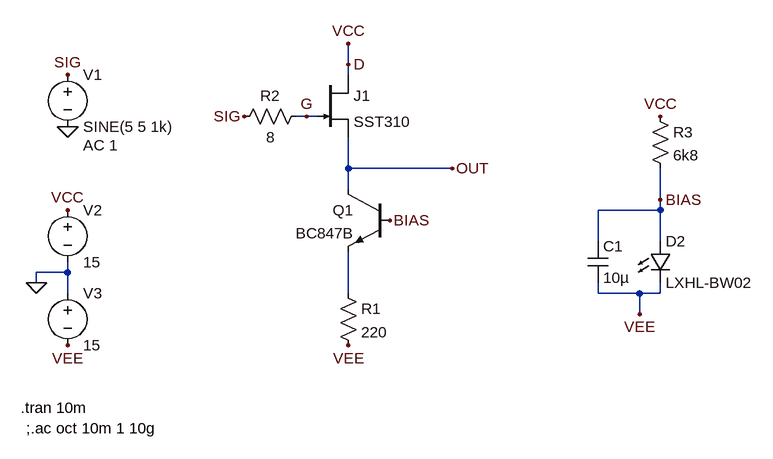
[diagram p0: schematic jfet-n.asc]
jfet-n.asc, the LTspice schematic file:
Version 4
SHEET 1 1144 680
WIRE 448 80 448 48
WIRE 448 96 448 80
WIRE 384 160 368 160
WIRE 400 160 384 160
WIRE 448 240 448 192
WIRE 608 240 448 240
WIRE 448 272 448 240
WIRE 928 288 928 240
WIRE 928 304 928 288
WIRE 928 304 832 304
WIRE 832 352 832 304
WIRE 928 352 928 304
WIRE 16 400 16 384
WIRE 16 400 -32 400
WIRE -32 416 -32 400
WIRE 16 432 16 400
WIRE 448 432 448 368
WIRE 832 432 832 416
WIRE 896 432 832 432
WIRE 928 432 928 416
WIRE 928 432 896 432
WIRE 896 464 896 432
FLAG 16 96 SIG
FLAG 16 176 0
FLAG 288 160 SIG
FLAG -32 416 0
FLAG 16 304 VCC
FLAG 16 512 VEE
FLAG 448 48 VCC
FLAG 928 160 VCC
FLAG 448 512 VEE
FLAG 896 464 VEE
FLAG 512 320 BIAS
FLAG 928 288 BIAS
FLAG 608 240 OUT
FLAG 384 160 G
FLAG 448 80 D
SYMBOL voltage 16 80 R0
WINDOW 123 24 124 Left 2
WINDOW 39 0 0 Left 0
SYMATTR Value2 AC 1
SYMATTR InstName V1
SYMATTR Value SINE(5 5 1k)
SYMBOL njf 400 96 R0
SYMATTR InstName J1
SYMATTR Value SST310
SYMBOL res 432 416 R0
SYMATTR InstName R1
SYMATTR Value 220
SYMBOL res 384 144 R90
WINDOW 0 0 56 VBottom 2
WINDOW 3 32 56 VTop 2
SYMATTR InstName R2
SYMATTR Value 8
SYMBOL npn 512 272 M0
SYMATTR InstName Q1
SYMATTR Value BC847B
SYMBOL voltage 16 288 R0
WINDOW 123 0 0 Left 0
WINDOW 39 0 0 Left 0
SYMATTR InstName V2
SYMATTR Value 15
SYMBOL voltage 16 416 R0
WINDOW 123 0 0 Left 0
WINDOW 39 0 0 Left 0
SYMATTR InstName V3
SYMATTR Value 15
SYMBOL res 912 144 R0
SYMATTR InstName R3
SYMATTR Value 6k8
SYMBOL cap 816 352 R0
SYMATTR InstName C1
SYMATTR Value 10µ
SYMBOL LED 912 352 R0
SYMATTR InstName D2
SYMATTR Value LXHL-BW02
TEXT -56 608 Left 2 !.tran 10m
TEXT -48 640 Left 2 !;.ac oct 10m 1 10g

The netlist it stands for:
* jfet-n.asc
V1 SIG 0 SINE(5 5 1k) AC 1
J1 D G OUT SST310
R1 N001 VEE 220
R2 G SIG 8
Q1 OUT BIAS N001 0 BC847B
V2 D 0 15
V3 0 VEE 15
R3 D BIAS 6k8
C1 BIAS VEE 10µ
D2 BIAS VEE LXHL-BW02
.model D D
.lib standard.dio
.model NPN NPN
.model PNP PNP
.lib standard.bjt
.model NJF NJF
.model PJF PJF
.lib standard.jft
.tran 10m
;.ac oct 10m 1 10g
.backanno
.end